# Altium project StmPCB.PrjPcb
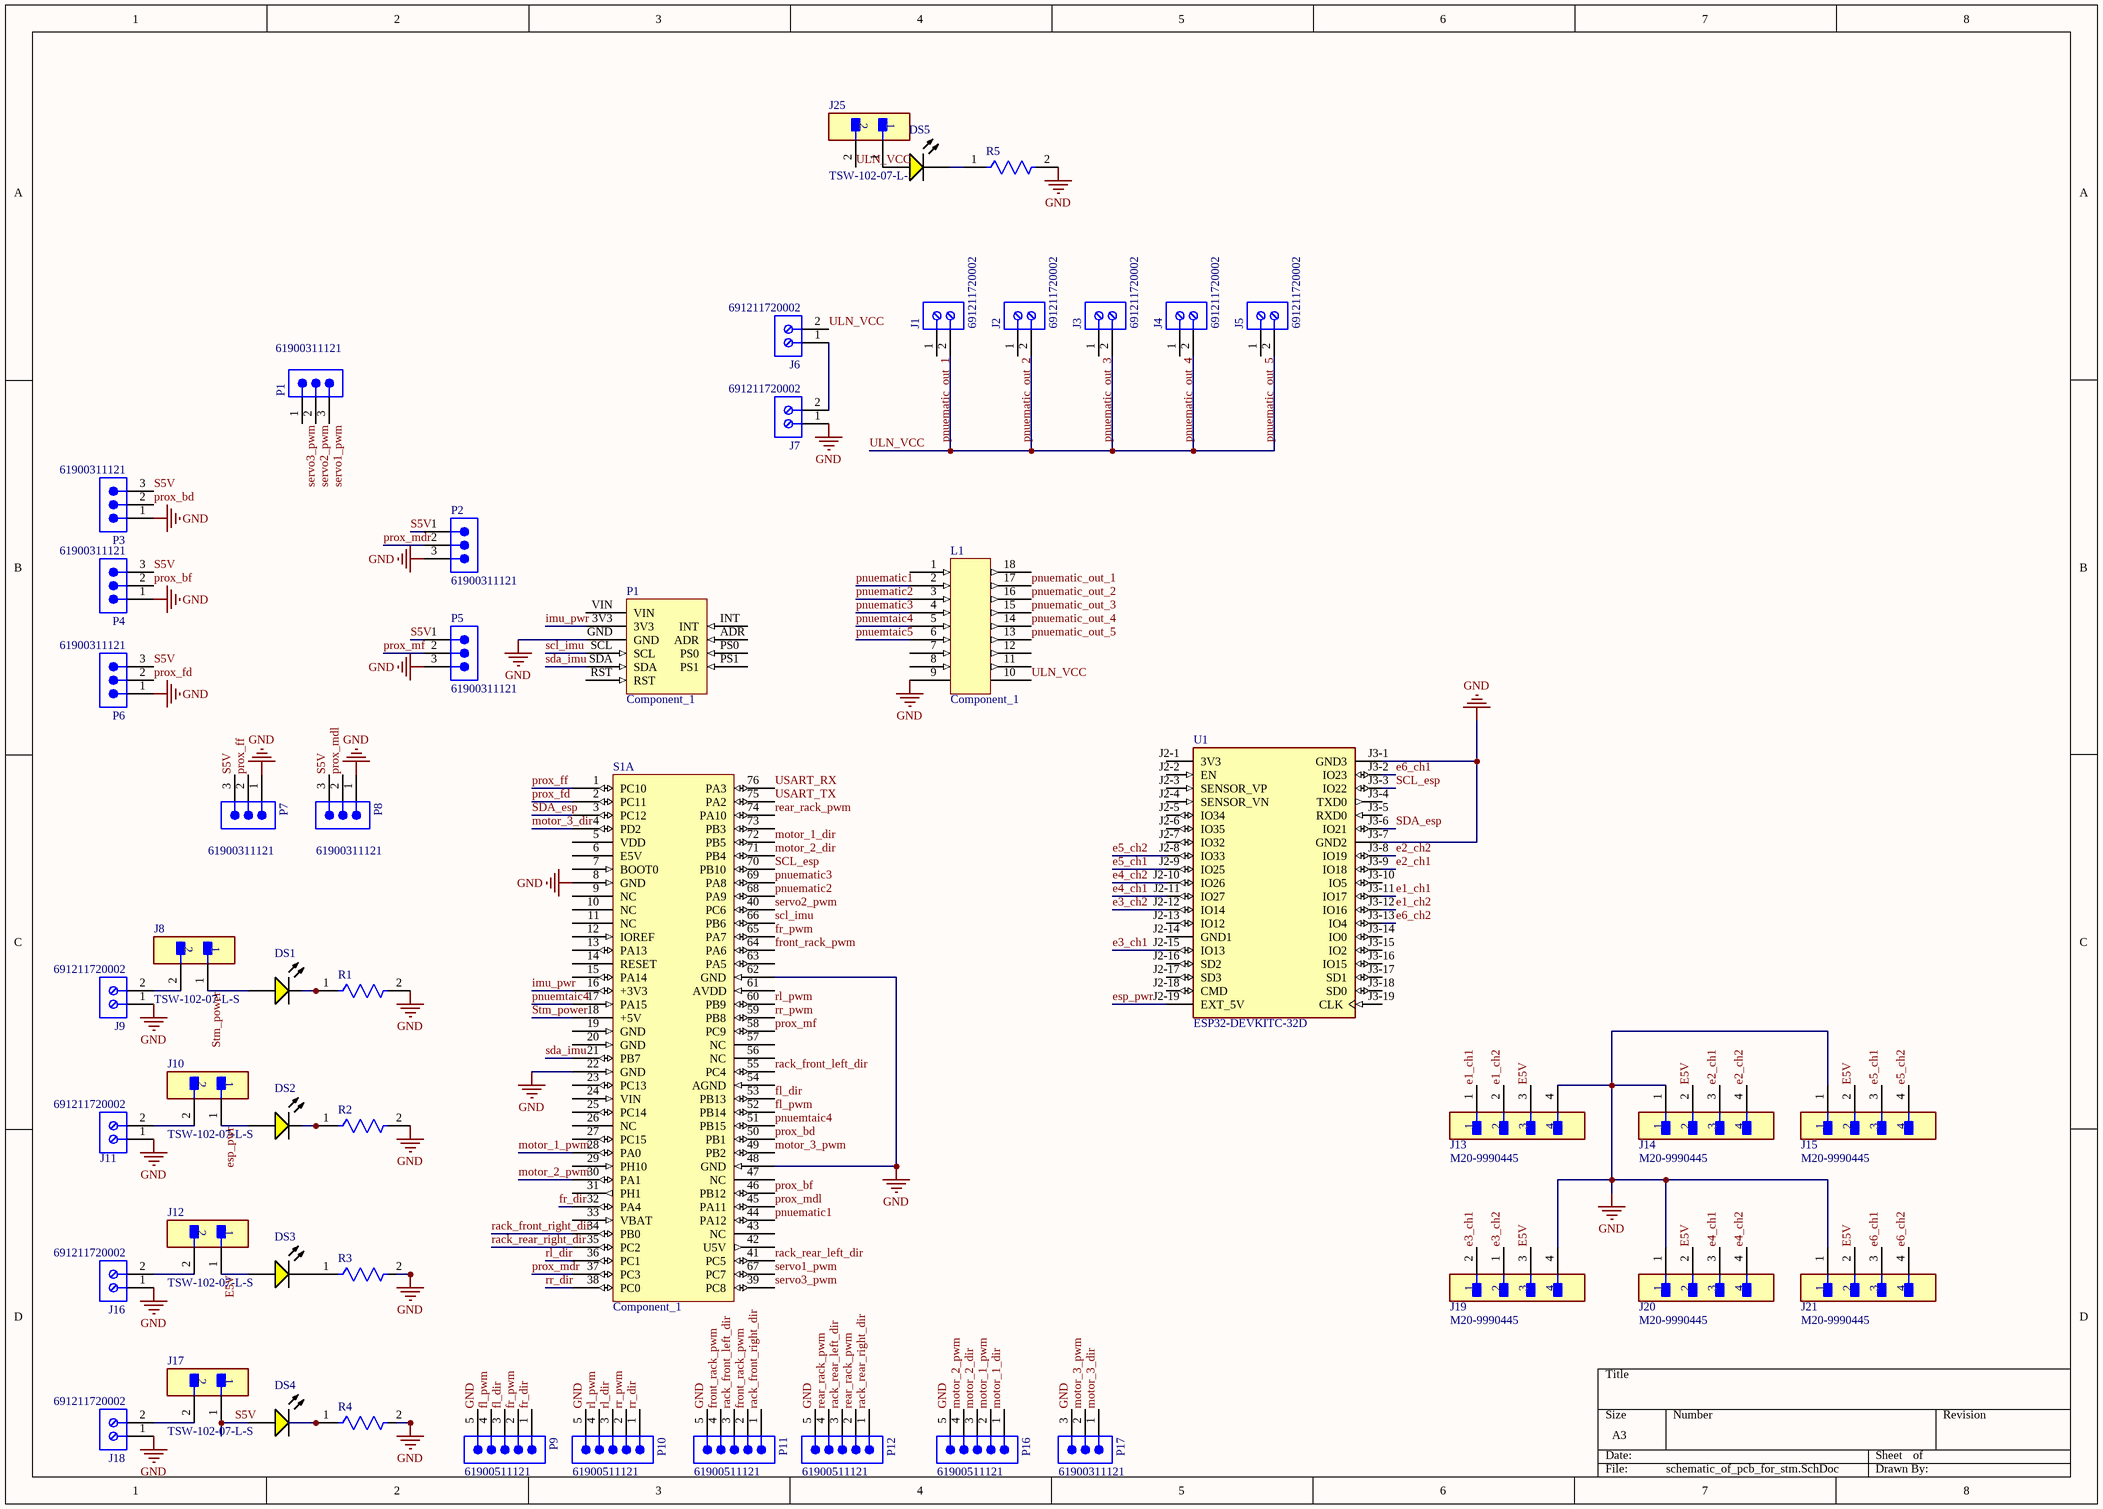
[diagram p0: schematic_of_pcb_for_stm.SchDoc]
2 sheets, 56 parts. Net scope: global (net labels, ports and power ports of the same name join across sheets).
Board files: pcb_document_of_best_pcb_ever.PcbDoc, pcb_of_servo_pwd.PcbDoc
Sheets:
  schematic_of_pcb_for_stm.SchDoc
  schematic_of_servo_power_distribution.SchDoc

## Sheet schematic_of_pcb_for_stm.SchDoc
size A3; SheetNumber: 1; SheetTotal: 2

### Parts
(Parts that share a designator on the sheet are numbered #1, #2 ... from top to bottom, then left to right.)
DS1  WP7113SYD  [KING-WP7113SYD_V]  (value not drawn)
DS2  WP7113SYD  [KING-WP7113SYD_V]  (value not drawn)
DS3  WP7113SYD  [KING-WP7113SYD_V]  (value not drawn)
DS4  WP7113SYD  [KING-WP7113SYD_V]  (value not drawn)
DS5  WP7113SYD  [KING-WP7113SYD_V]  (value not drawn)
J1  691211720002  [691211720002]
J2  691211720002  [691211720002]
J3  691211720002  [691211720002]
J4  691211720002  [691211720002]
J5  691211720002  [691211720002]
J6  691211720002  [691211720002]
J7  691211720002  [691211720002]
J8  TSW-102-07-L-S  [FP-TSW-102-07-L-S-MFG]
J9  691211720002  [691211720002]
J10  TSW-102-07-L-S  [FP-TSW-102-07-L-S-MFG]
J11  691211720002  [691211720002]
J12  TSW-102-07-L-S  [FP-TSW-102-07-L-S-MFG]
J13  M20-9990445  [FP-M20-9990445-MFG]
J14  M20-9990445  [FP-M20-9990445-MFG]
J15  M20-9990445  [FP-M20-9990445-MFG]
J16  691211720002  [691211720002]
J17  TSW-102-07-L-S  [FP-TSW-102-07-L-S-MFG]
J18  691211720002  [691211720002]
J19  M20-9990445  [FP-M20-9990445-MFG]
J20  M20-9990445  [FP-M20-9990445-MFG]
J21  M20-9990445  [FP-M20-9990445-MFG]
J25  TSW-102-07-L-S  [FP-TSW-102-07-L-S-MFG]
L1  Component_1  [DIP18]
P1#1  61900311121  [61900311121]
P1#2  Component_1  [PCBComponent_1]
P2  61900311121  [61900311121]
P3  61900311121  [61900311121]
P4  61900311121  [61900311121]
P5  61900311121  [61900311121]
P6  61900311121  [61900311121]
P7  61900311121  [61900311121]
P8  61900311121  [61900311121]
P9  61900511121  [61900511121]
P10  61900511121  [61900511121]
P11  61900511121  [61900511121]
P12  61900511121  [61900511121]
P16  61900511121  [61900511121]
P17  61900311121  [61900311121]
R1  CF18JT10K0  [FP-CF18-MFG]  (value not drawn)
R2  CF18JT10K0  [FP-CF18-MFG]  (value not drawn)
R3  CF18JT10K0  [FP-CF18-MFG]  (value not drawn)
R4  CF18JT10K0  [FP-CF18-MFG]  (value not drawn)
R5  CF18JT10K0  [FP-CF18-MFG]  (value not drawn)
S1  Component_1  [PCBComponent_1]  (part A of 4)
U1  ESP32-DEVKITC-32D  [MODULE_ESP32-DEVKITC-32D]

### Nets
GND: J7.1 J9.1 J11.1 J13.4 J14.1 J15.1 J16.1 J18.1 J19.4 J20.1 J21.1 L1.9 P1#2.GND P2.3 P3.1 P4.1 P5.3 P6.1 P7.1 P8.1 P9.5 P10.5 P11.5 P12.5 P16.5 P17.3 R1.2 R2.2 R3.2 R4.2 R5.2 S1.8(GND) S1.22(GND) S1.48(GND) S1.62(GND) U1.J3-1(GND3) U1.J3-7(GND2)
e1_ch1: J13.1 U1.J3-11(IO17)
e1_ch2: J13.2 U1.J3-12(IO16)
e2_ch1: J14.3 U1.J3-9(IO18)
e2_ch2: J14.4 U1.J3-8(IO19)
e3_ch1: J19.2 U1.J2-15(IO13)
e3_ch2: J19.1 U1.J2-12(IO14)
e4_ch1: J20.3 U1.J2-11(IO27)
e4_ch2: J20.4 U1.J2-10(IO26)
e5_ch1: J15.3 U1.J2-9(IO25)
e5_ch2: J15.4 U1.J2-8(IO33)
E5V: DS3.1(A) J12.1 J13.3 J14.2 J15.2 J19.3 J20.2 J21.2
e6_ch1: J21.3 U1.J3-2(IO23)
e6_ch2: J21.4 U1.J3-13(IO4)
esp_pwr: DS2.1(A) J10.1 U1.J2-19(EXT_5V)
fl_dir: P9.3 S1.53(PB13)
fl_pwm: P9.4 S1.52(PB14)
fr_dir: P9.1 S1.32(PA4)
fr_pwm: P9.2 S1.65(PA7)
front_rack_pwm: P11.2 P11.4 S1.64(PA6)
imu_pwr: P1#2.3V3 S1.16(+3V3)
motor_1_dir: P16.1 S1.72(PB5)
motor_1_pwm: P16.2 S1.28(PA0)
motor_2_dir: P16.3 S1.71(PB4)
motor_2_pwm: P16.4 S1.30(PA1)
motor_3_dir: P17.1 S1.4(PD2)
motor_3_pwm: P17.2 S1.49(PB2)
pnuematic1: L1.2 S1.44(PA12)
pnuematic2: L1.3 S1.68(PA9)
pnuematic3: L1.4 S1.69(PA8)
pnuematic_out_1: J1.1 L1.17
pnuematic_out_2: J2.1 L1.16
pnuematic_out_3: J3.1 L1.15
pnuematic_out_4: J4.1 L1.14
pnuematic_out_5: J5.1 L1.13
pnuemtaic4: L1.5 S1.17(PA15) S1.51(PB15)
pnuemtaic5: L1.6
prox_bd: P3.2 S1.50(PB1)
prox_bf: P4.2 S1.46(PB12)
prox_fd: P6.2 S1.2(PC11)
prox_ff: P7.2 S1.1(PC10)
prox_mdl: P8.2 S1.45(PA11)
prox_mdr: P2.2 S1.37(PC3)
prox_mf: P5.2 S1.58(PC9)
rack_front_left_dir: P11.3 S1.55(PC4)
rack_front_right_dir: P11.1 S1.34(PB0)
rack_rear_left_dir: P12.3 S1.41(PC5)
rack_rear_right_dir: P12.1 S1.35(PC2)
rear_rack_pwm: P12.2 P12.4 S1.74(PA10)
rl_dir: P10.3 S1.36(PC1)
rl_pwm: P10.4 S1.60(PB9)
rr_dir: P10.1 S1.38(PC0)
rr_pwm: P10.2 S1.59(PB8)
S5V: DS4.1(A) J17.1 P2.1 P3.3 P4.3 P5.1 P6.3 P7.3 P8.3
SCL_esp: S1.70(PB10) U1.J3-3(IO22)
scl_imu: P1#2.SCL S1.66(PB6)
SDA_esp: S1.3(PC12) U1.J3-6(IO21)
sda_imu: P1#2.SDA S1.21(PB7)
servo1_pwm: P1#1.3 S1.67(PC7)
servo2_pwm: P1#1.2 S1.40(PC6)
servo3_pwm: P1#1.1 S1.39(PC8)
Stm_power: DS1.1(A) J8.1 S1.18(+5V)
ULN_VCC: J1.2 J2.2 J3.2 J4.2 J5.2 J6.2 J25.2 L1.10
USART_RX: S1.76(PA3)
USART_TX: S1.75(PA2)
NetDS1_2: DS1.2(K) R1.1
NetDS2_2: DS2.2(K) R2.1
NetDS3_2: DS3.2(K) R3.1
NetDS4_2: DS4.2(K) R4.1
NetDS5_1: DS5.1(A) J25.1
NetDS5_2: DS5.2(K) R5.1
NetJ6_1: J6.1 J7.2
NetJ8_2: J8.2 J9.2
NetJ10_2: J10.2 J11.2
NetJ12_2: J12.2 J16.2
NetJ17_2: J17.2 J18.2

Not connected (* = marked no-connect by the designer): L1 1 7 8 11 12 18; P1#2 ADR INT PS0 PS1 RST VIN; S1 5(VDD) 6(E5V) 7(BOOT0) 9(NC) 10(NC) 11(NC) 12(IOREF) 13(PA13) 14(RESET) 15(PA14) 19(GND) 20(GND) 23(PC13) 24(VIN) 25(PC14) 26(NC) 27(PC15) 29(PH10) 31(PH1) 33(VBAT) 42(U5V) 43(NC) 47(NC) 54(AGND) 56(NC) 57(NC) 61(AVDD) 63(PA5) 73(PB3); U1 J2-1(3V3) J2-2(EN) J2-3(SENSOR_VP) J2-4(SENSOR_VN) J2-5(IO34) J2-6(IO35) J2-7(IO32) J2-13(IO12) J2-14(GND1) J2-16(SD2) J2-17(SD3) J2-18(CMD) J3-4(TXD0) J3-5(RXD0) J3-10(IO5) J3-14(IO0) J3-15(IO2) J3-16(IO15) J3-17(SD1) J3-18(SD0) J3-19(CLK)

### Library data of the parts
DS1-DS5 = CMP-1757-00003-1: The Super Bright Yellow Device, 2 V, -40 to 85 degC, 2-Pin THD, RoHS, Tape and Reel; Tolerance: 1%; Power Rating: 250 mW; Voltage Rating: 250 V; Resistance: 22.1 kohm; Case\Package: Axial; Length: 0.248 inch; Max Operating Temperature: 155 degC; PackageDescription: 2-Pin Through Hole Device, Dia 5.9 mm, Body Length 8.6 mm; Package Quantity: 200; ComponentLink1Description: Datasheet; Mount: Through Hole; DatasheetVersion: Rev. 7B, 01/2015; RoHSCompliant: true; PackageReference: WP7113SYD; ComponentLink1URL: http://www.kingbrightusa.com/images/catalog/SPEC/WP7113SYD.pdf; Packaging: Bulk; Min Operating Temperature: -55 degC
J1-J7 J9 J11 J16 J18 = CMP-1502-02524-3: 211 Series 5MM Pitch Straight, Pcb Terminal Block, Through Hole, 2 Way; Number of Levels: 1; Current: 10A; Voltage: 300V; Pitch: 5.0038mm; Wire Gauge (Min): 12AWG; Connector Type: PCB, Terminal Block; Number of Positions Per Level: 2; Plating: Brass, Steel; Wire Gauge (Max): 24AWG; Stripping Length: -7mm; Termination: Screw; Height: 15.5mm; Contact Plating: Tin; REACH SVHC: Unknown; Contact Material: Brass; Width: 10mm; RoHS: Compliant; Number of Pins: 2; Lead Pitch: 5mm; Mount: Through Hole; Min Operating Temperature: -40°C; Length: 13.7mm; Number of Contacts: 2; Color: Green; Wire/Cable Gauge: 12AWG; Housing Material: Nylon; Packaging: Box; Max Operating Temperature: 105°C
J8 J10 J12 J17 J25 = CMP-02766-001428-1: CONN HEADER VERT 2POS 2.54MM; Voltage Rating: 550V; Current Rating: 7.6A; Gender: Male; Number of Contacts: 2; Connector Type: Male Pin; Radiation Hardening: No; Orientation: Straight; Contact Plating: Gold; Max Operating Temperature: 125°C; Mount: Through Hole; Package Quantity: 1; Number of Rows: 1; Housing Material: Polyester; RoHS Compliant: Yes; Length: 5.08mm; Max Voltage Rating (AC): 550V; Pitch: 2.54mm; Packaging: Bulk; Depth: 2.54mm; Termination: Solder; Min Operating Temperature: -55°C; Housing Color: Black; Lead Free: Lead Free; Color: Black; Number of Positions: 2; Width: 2.54mm; Max Current Rating: 7.6A; REACH SVHC: No SVHC; Contact Material: Bronze; Contact Mating Length: 0.23inch; Series: TSW; Contact Type: Male Pin
J13-J15 J19-J21 = CMP-00671-05399696-1: M20-9990445 Conn Unshrouded Header HDR 4 POS 2.54mm Solder ST Thru-Hole Bulk/Loose; Insulation Resistance: 10GΩ; Connector Type: Male Pin; Voltage Rating (DC): 750V; Max Current Rating: 3A; Contact Resistance: 25mΩ; Number of Contacts: 4; Gender: Male; Color: Black; Height: 2.54mm; Contact Material: Brass, Bronze, Gold, Nickel; Orientation: Straight; Width: 12.7mm; Mount: Through Hole; Pitch: 2.54mm; Lead Pitch: 2.54mm; RoHS: Compliant; Max Operating Temperature: 105°C; Case/Package: SIL; NexarPartId: 5399696; Depth: 2.54mm; Length: 10.16mm; Current Rating: 3A; Contact Plating: Gold; Radiation Hardening: No; Contact Mating Length: 6.096mm; Voltage Rating (AC): 750V; Termination: Solder; REACH SVHC: No SVHC; Weight: 45.359237g; Number of Rows: 1; Min Operating Temperature: -40°C; Housing Material: Nylon; Housing Color: Black; Number of Positions: 4; Number of Pins: 4
P1#1 P2-P8 P17 = CMP-1502-00585-3: Wr-wtb Series, 2.54MM Pitch 3 Way 1 Row Straight Pcb Header, Through Hole; Number of Contacts: 3; Contact Resistance: 20mΩ; Gender: Male; Connector Type: Male Pin; Voltage Rating: 250V; Insulation Resistance: 1GΩ; Current Rating: 3A; Width: 7.66mm; Mount: Through Hole; Pitch: 2.54mm; Housing Material: Nylon; Contact Mating Length: 7.493mm; Flammability Rating: UL94 V-0; Fastening Type: Friction; Height: 12.5mm; Number of Rows: 1; Orientation: Vertical; Packaging: Bulk; Contact Material: Copper; Max Operating Temperature: 105°C; Contact Plating: Tin; Operating Supply Voltage: 250V; Termination: Through Hole; Number of Pins: 3; Min Operating Temperature: -40°C; Contact Gender: Male; Color: Beige; RoHS: Compliant; Lead Pitch: 2.54mm; Length: 7.62mm; Number of Positions: 3
P9-P12 P16 = CMP-1502-00587-3: Wr-wtb Series, 2.54MM Pitch 5 Way 1 Row Straight Pcb Header, Through Hole; Contact Resistance: 20mΩ; Number of Contacts: 5; Operating Supply Voltage: 250V; Current Rating: 3A; Gender: Male; Insulation Resistance: 1GΩ; Connector Type: Male Pin; Fastening Type: Friction; Termination: Through Hole; Lead Pitch: 2.54mm; RoHS: Compliant; Contact Gender: Male; Width: 12.74mm; Mount: Through Hole; Color: Beige; Contact Material: Copper; Height: 12.5mm; Number of Pins: 5; Length: 12.7mm; Packaging: Bulk; Pitch: 2.54mm; Contact Mating Length: 7.493mm; Housing Material: Nylon; Max Operating Temperature: 105°C; Orientation: Vertical; Number of Rows: 1; Contact Plating: Tin; Voltage Rating: 250V; Flammability Rating: UL94 V-0; Number of Positions: 5; Lead Free: Lead Free; Min Operating Temperature: -40°C
R1-R5 = CMP-26528-000002-1: RES 10K OHM 1/8W 5% CF AXIAL; Manufacturer: Stackpole Electronics; Power Rating: 0.125W; Temperature Coefficient: 0-500ppm/°C; Resistance: 10kΩ; Voltage Rating: 250V; Value: 10kΩ; Temperature: -55°C to +155°C; Height: 2mm; Lead Free: Yes; Automotive: No; Device Class L2: Resistors; Package: CF18; Series: CF; ComponentLink2Description: Datasheet; Ipc Land Pattern Name: RESAD656W65L360D200; Manufacturer Part Number: CF18JT10K0; Temperature Range High: +155°C; RoHS: TRUE; Device Class L3: Through-Hole Resistors; Temperature Range Low: -55°C; Device Class L1: Passive Components; Category: Res; Octopart: https://octopart.com/cf18jt10k0-stackpole+electronics-19205642; Composition: Carbon Film; Digikey Description: RES 10K OHM 1/8W 5% CF AXIAL; ComponentLink2URL: http://www.seielect.com/Catalog/SEI-CF_CFM.pdf; Tolerance: 5%
U1 = ESP32-DEVKITC-32D: WiFi Development Tools (802.11) ESP32 General Development Kit, ESP32-WROOM-32D on the board; MF: Espressif Systems; SnapEDA_Link: https://www.snapeda.com/parts/ESP32-DEVKITC-32D/Espressif+Systems/view-part/?ref=snap; Package: None; Value: *; MP: ESP32-DEVKITC-32D; Check_prices: https://www.snapeda.com/parts/ESP32-DEVKITC-32D/Espressif+Systems/view-part/?ref=eda

## Sheet schematic_of_servo_power_distribution.SchDoc
size A4; SheetNumber: 2; SheetTotal: 2
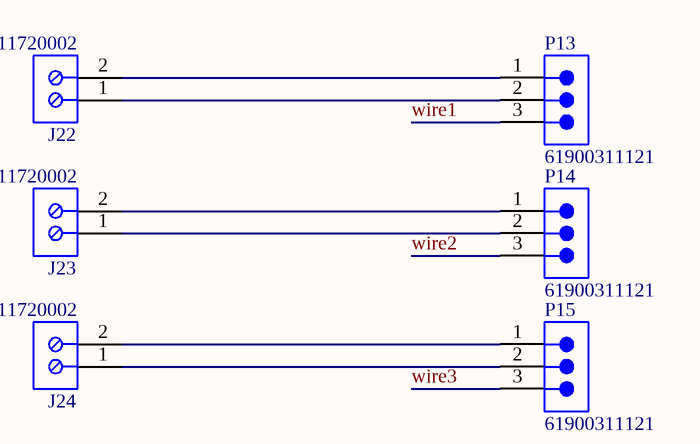
[diagram p1: schematic_of_servo_power_distribution.SchDoc]

### Parts
J22  691211720002  [691211720002]
J23  691211720002  [691211720002]
J24  691211720002  [691211720002]
P13  61900311121  [61900311121]
P14  61900311121  [61900311121]
P15  61900311121  [61900311121]

### Nets
wire1: P13.3
wire2: P14.3
wire3: P15.3
NetJ22_1: J22.1 P13.2
NetJ22_2: J22.2 P13.1
NetJ23_1: J23.1 P14.2
NetJ23_2: J23.2 P14.1
NetJ24_1: J24.1 P15.2
NetJ24_2: J24.2 P15.1

### Library data of the parts
J22-J24 = CMP-1502-02524-3: as J1 on sheet schematic_of_pcb_for_stm; Termination: Screw; Height: 15.5mm; Contact Plating: Tin; REACH SVHC: Unknown; Contact Material: Brass; Width: 10mm; RoHS: Compliant; Number of Pins: 2; Lead Pitch: 5mm; Mount: Through Hole; Min Operating Temperature: -40°C; Length: 13.7mm; Number of Contacts: 2; Color: Green; Wire/Cable Gauge: 12AWG; Housing Material: Nylon; Packaging: Box; Max Operating Temperature: 105°C
P13-P15 = CMP-1502-00585-3: as P1#1 on sheet schematic_of_pcb_for_stm; Width: 7.66mm; Mount: Through Hole; Pitch: 2.54mm; Housing Material: Nylon; Contact Mating Length: 7.493mm; Flammability Rating: UL94 V-0; Fastening Type: Friction; Height: 12.5mm; Number of Rows: 1; Orientation: Vertical; Packaging: Bulk; Contact Material: Copper; Max Operating Temperature: 105°C; Contact Plating: Tin; Operating Supply Voltage: 250V; Termination: Through Hole; Number of Pins: 3; Min Operating Temperature: -40°C; Contact Gender: Male; Color: Beige; RoHS: Compliant; Lead Pitch: 2.54mm; Length: 7.62mm; Number of Positions: 3